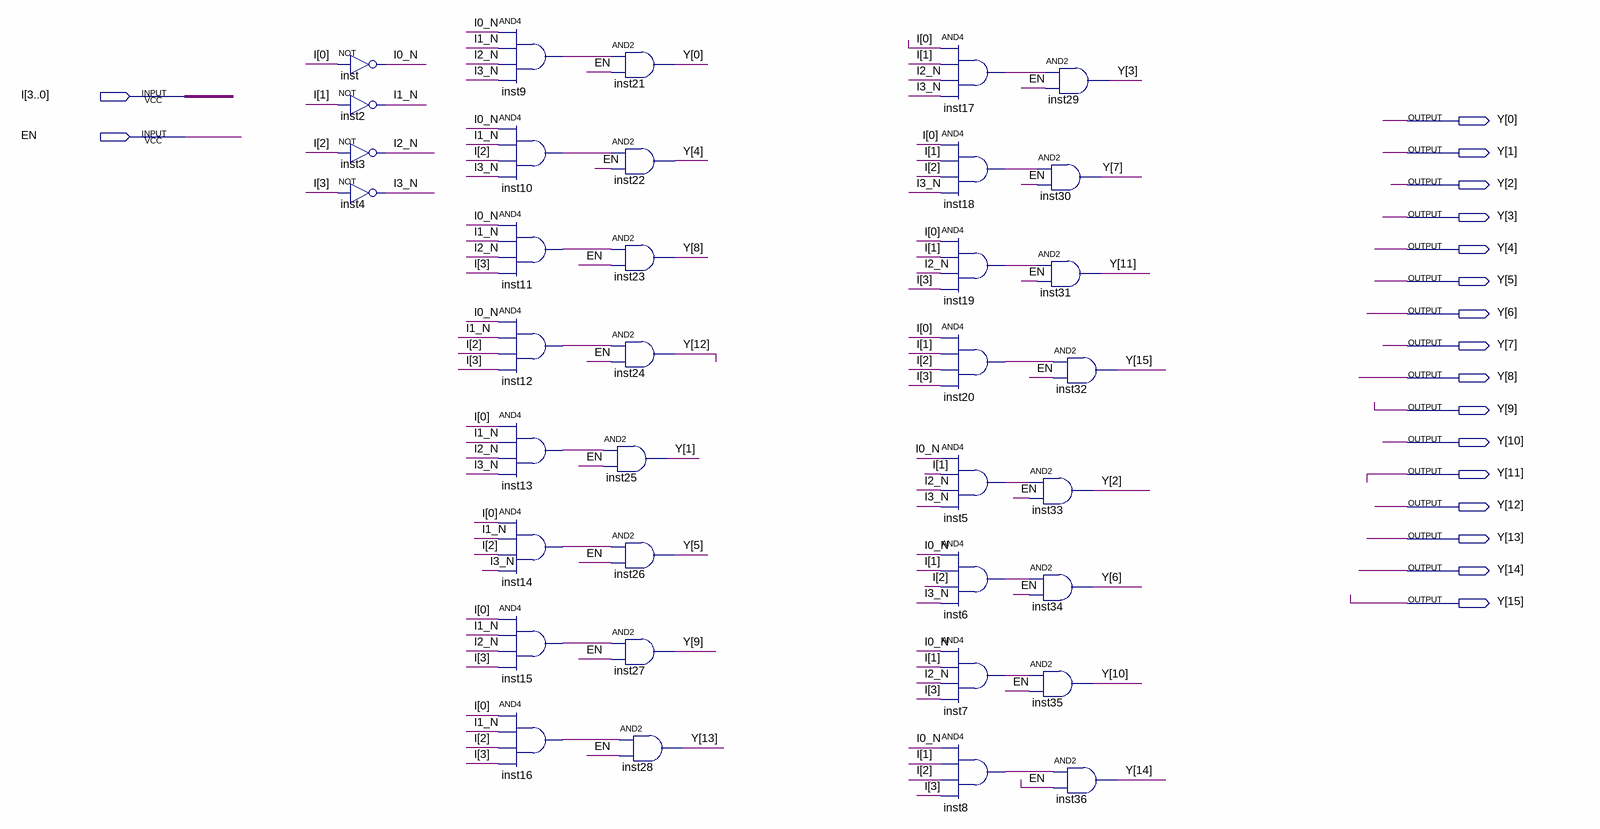
[diagram p0: schematic sheet]
// Quartus schematic decoder4to16.bdf as structural Verilog: 36 symbols, 18 pins
module decoder4to16 (
  input  [3:0] I,
  input  EN,
  output [15:0] Y
);

  wire I0_N, I1_N, I2_N, I3_N, inst5_out, inst6_out, inst7_out, inst8_out, inst9_out, inst10_out, inst11_out,
       inst12_out, inst13_out, inst14_out, inst15_out, inst16_out, inst17_out, inst18_out, inst19_out,
       inst20_out;

  not inst (I0_N, I[0]);
  not inst2 (I1_N, I[1]);
  not inst3 (I2_N, I[2]);
  not inst4 (I3_N, I[3]);
  and inst9 (inst9_out, I0_N, I1_N, I2_N, I3_N);
  and inst10 (inst10_out, I0_N, I1_N, I[2], I3_N);
  and inst11 (inst11_out, I0_N, I1_N, I2_N, I[3]);
  and inst12 (inst12_out, I0_N, I1_N, I[2], I[3]);
  and inst13 (inst13_out, I[0], I1_N, I2_N, I3_N);
  and inst14 (inst14_out, I[0], I1_N, I[2], I3_N);
  and inst15 (inst15_out, I[0], I1_N, I2_N, I[3]);
  and inst16 (inst16_out, I[0], I1_N, I[2], I[3]);
  and inst21 (Y[0], inst9_out, EN);
  and inst22 (Y[4], inst10_out, EN);
  and inst23 (Y[8], inst11_out, EN);
  and inst24 (Y[12], inst12_out, EN);
  and inst25 (Y[1], inst13_out, EN);
  and inst26 (Y[5], inst14_out, EN);
  and inst27 (Y[9], inst15_out, EN);
  and inst28 (Y[13], inst16_out, EN);
  and inst17 (inst17_out, I[0], I[1], I2_N, I3_N);
  and inst18 (inst18_out, I[0], I[1], I[2], I3_N);
  and inst19 (inst19_out, I[0], I[1], I2_N, I[3]);
  and inst20 (inst20_out, I[0], I[1], I[2], I[3]);
  and inst5 (inst5_out, I0_N, I[1], I2_N, I3_N);
  and inst6 (inst6_out, I0_N, I[1], I[2], I3_N);
  and inst7 (inst7_out, I0_N, I[1], I2_N, I[3]);
  and inst8 (inst8_out, I0_N, I[1], I[2], I[3]);
  and inst29 (Y[3], inst17_out, EN);
  and inst30 (Y[7], inst18_out, EN);
  and inst31 (Y[11], inst19_out, EN);
  and inst33 (Y[2], inst5_out, EN);
  and inst34 (Y[6], inst6_out, EN);
  and inst35 (Y[10], inst7_out, EN);
  and inst32 (Y[15], inst20_out, EN);
  and inst36 (Y[14], inst8_out, EN);
endmodule
